# Altium schematic sheet 05 - FPGA_IO_SRAM.SchDoc
size A3; SheetNumber: 3; SheetTotal: 7
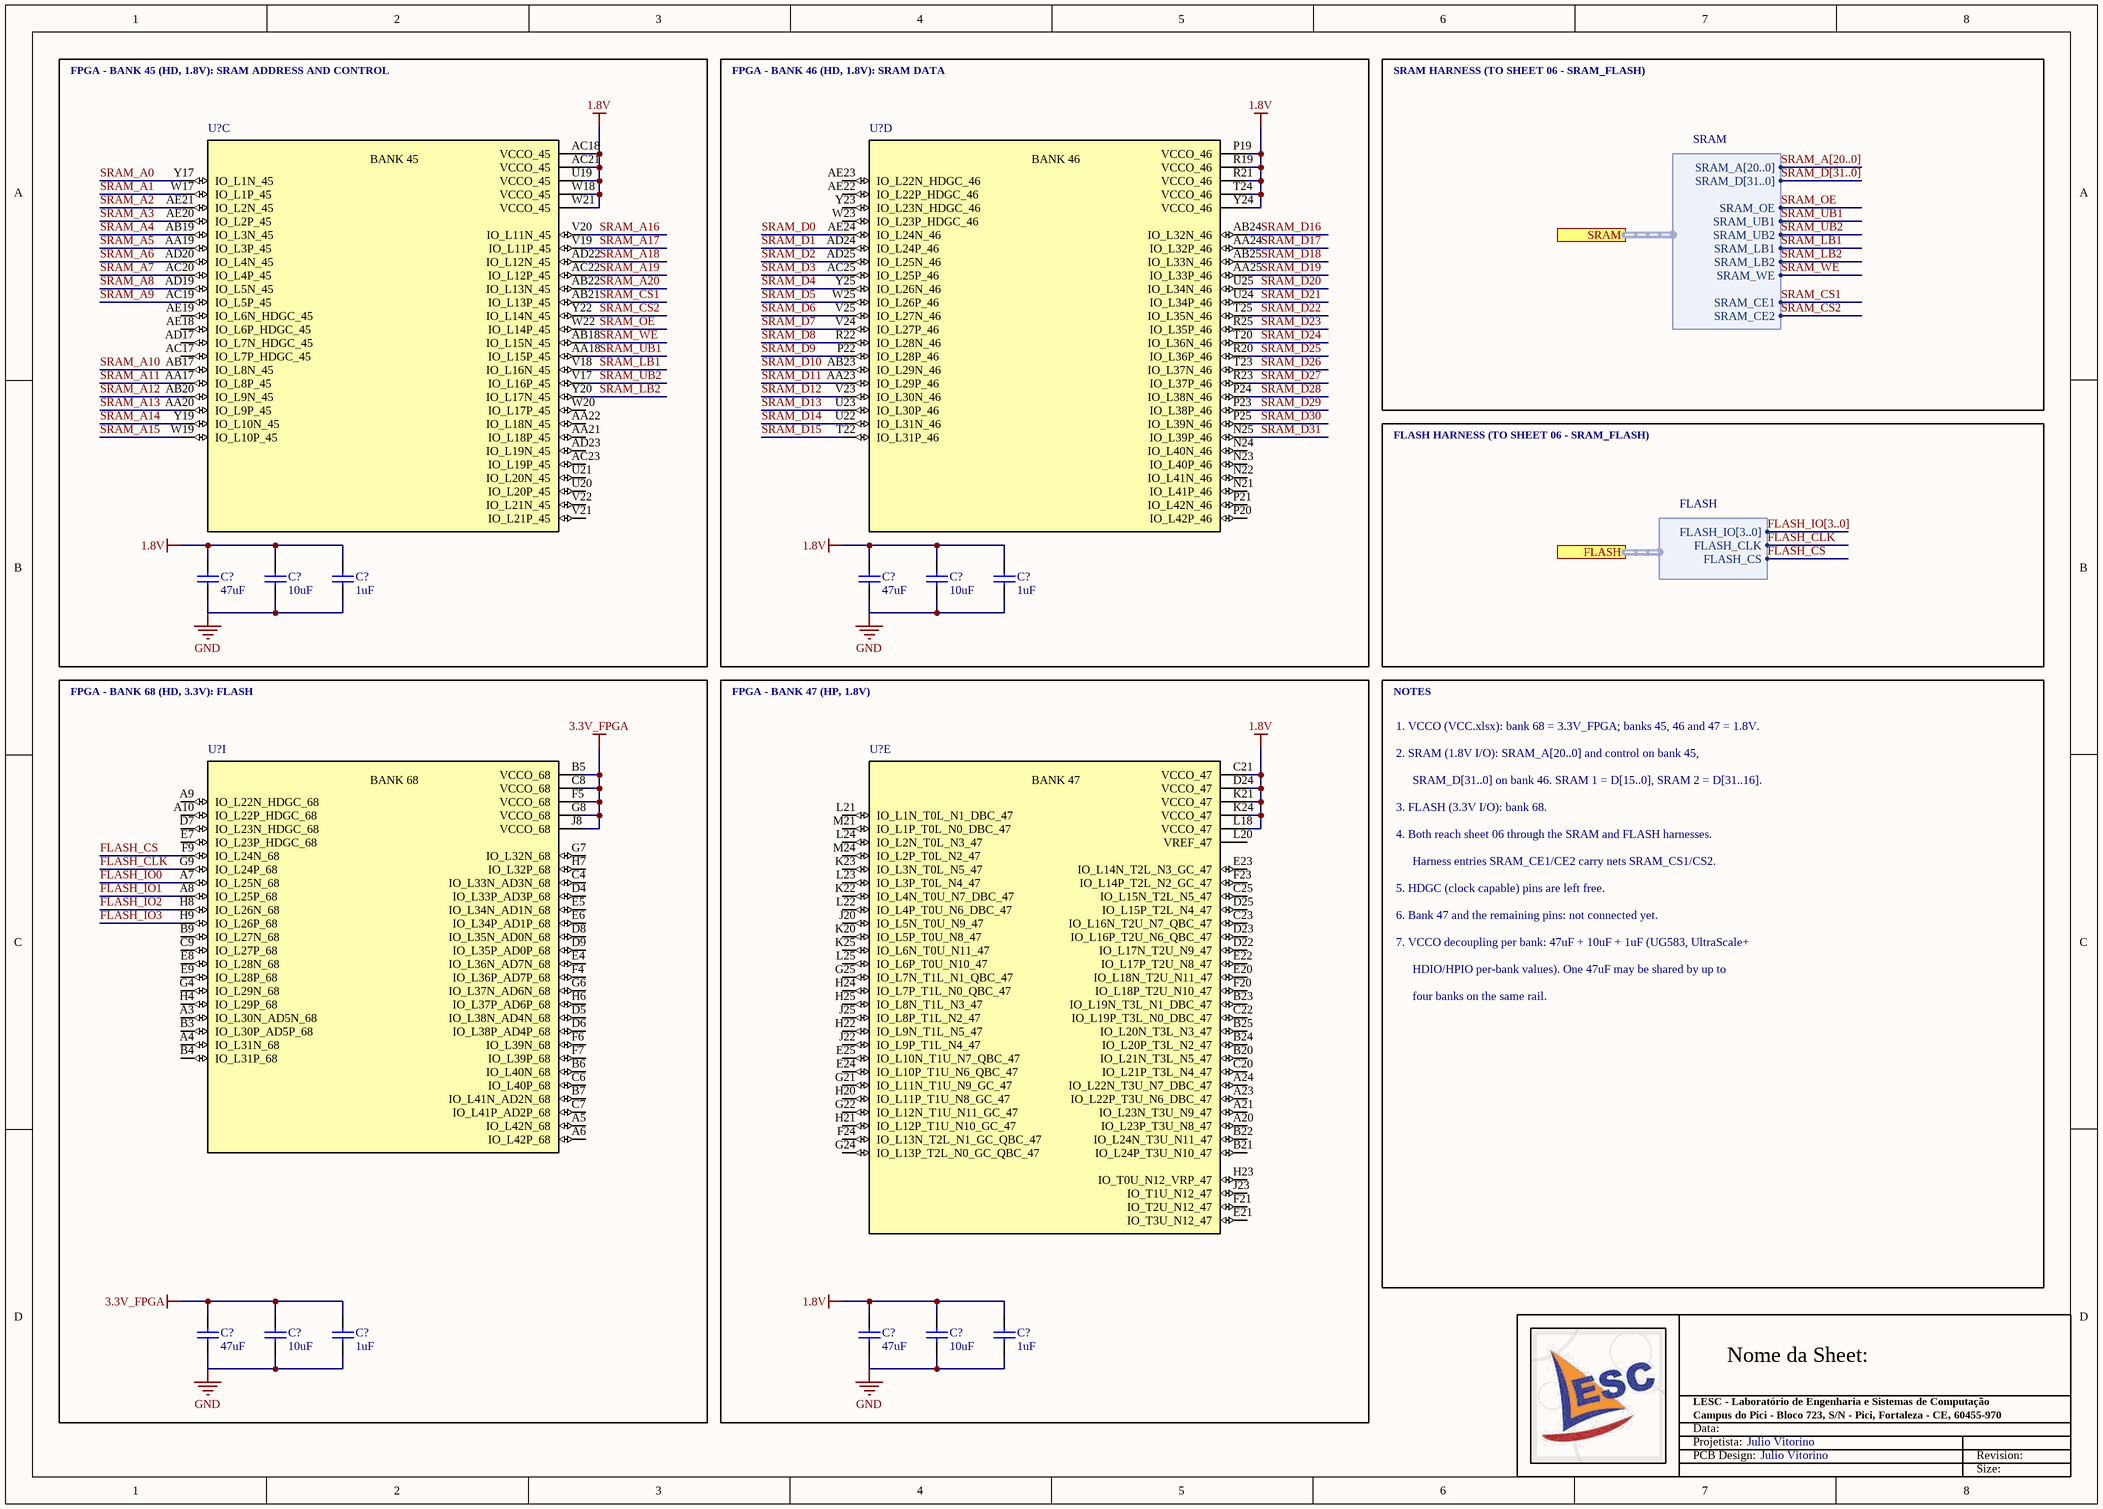
[diagram p0: 05 - FPGA_IO_SRAM.SchDoc]

## Parts
(Parts that share a designator on the sheet are numbered #1, #2 ... from top to bottom, then left to right.)
C?#1  value 47uF  [0603-C-R]  (hidden comment: ZRB18AR60J476ME01L)
C?#2  CAPACITANCE: 10uF  [0402-C-R]  (hidden comment: CAP CER 10UF 6.3V X5R 0402)
C?#3  value 1uF  [0402-C-R]  (hidden comment: JMK105BJ105KV-F)
C?#4  value 47uF  [0603-C-R]  (hidden comment: ZRB18AR60J476ME01L)
C?#5  CAPACITANCE: 10uF  [0402-C-R]  (hidden comment: CAP CER 10UF 6.3V X5R 0402)
C?#6  value 1uF  [0402-C-R]  (hidden comment: JMK105BJ105KV-F)
C?#7  value 47uF  [0603-C-R]  (hidden comment: ZRB18AR60J476ME01L)
C?#8  CAPACITANCE: 10uF  [0402-C-R]  (hidden comment: CAP CER 10UF 6.3V X5R 0402)
C?#9  value 1uF  [0402-C-R]  (hidden comment: JMK105BJ105KV-F)
C?#10  value 47uF  [0603-C-R]  (hidden comment: ZRB18AR60J476ME01L)
C?#11  CAPACITANCE: 10uF  [0402-C-R]  (hidden comment: CAP CER 10UF 6.3V X5R 0402)
C?#12  value 1uF  [0402-C-R]  (hidden comment: JMK105BJ105KV-F)
U?#1  IC FPGA 304 I/O 625-BGA/FCBGA  [BGA625C80P25X25_2100X2100X192]  (value not drawn)  (part C of 11)
U?#2  IC FPGA 304 I/O 625-BGA/FCBGA  [BGA625C80P25X25_2100X2100X192]  (value not drawn)  (part D of 11)
U?#3  IC FPGA 304 I/O 625-BGA/FCBGA  [BGA625C80P25X25_2100X2100X192]  (value not drawn)  (part I of 11)
U?#4  IC FPGA 304 I/O 625-BGA/FCBGA  [BGA625C80P25X25_2100X2100X192]  (value not drawn)  (part E of 11)

## Blocks framed on the sheet
FPGA - BANK 45 (HD, 1.8V): SRAM ADDRESS AND CONTROL: C?#1-C?#3 U?#1
FPGA - BANK 46 (HD, 1.8V): SRAM DATA: C?#4-C?#6 U?#2
FPGA - BANK 68 (HD, 3.3V): FLASH: C?#7-C?#9 U?#3
FPGA - BANK 47 (HP, 1.8V): C?#10-C?#12 U?#4

## Ports
FLASH (harness FLASH), SRAM (harness SRAM)

## Harnesses
SRAM: SRAM_A[20..0], SRAM_D[31..0], SRAM_OE, SRAM_UB1, SRAM_UB2, SRAM_WE, SRAM_CE1, SRAM_CE2, SRAM_LB2, SRAM_LB1
FLASH: FLASH_IO[3..0], FLASH_CLK, FLASH_CS

## Nets
1.8V: C?#1.2 C?#2.2 C?#3.2 C?#4.2 C?#5.2 C?#6.2 C?#10.2 C?#11.2 C?#12.2 U?#1.AC18(VCCO_45) U?#1.AC21(VCCO_45) U?#1.U19(VCCO_45) U?#1.W18(VCCO_45) U?#1.W21(VCCO_45) U?#2.P19(VCCO_46) U?#2.R19(VCCO_46) U?#2.R21(VCCO_46) U?#2.T24(VCCO_46) U?#2.Y24(VCCO_46) U?#4.C21(VCCO_47) U?#4.D24(VCCO_47) U?#4.K21(VCCO_47) U?#4.K24(VCCO_47) U?#4.L18(VCCO_47)
3.3V_FPGA: C?#7.2 C?#8.2 C?#9.2 U?#3.B5(VCCO_68) U?#3.C8(VCCO_68) U?#3.F5(VCCO_68) U?#3.G8(VCCO_68) U?#3.J8(VCCO_68)
GND: C?#1.1 C?#2.1 C?#3.1 C?#4.1 C?#5.1 C?#6.1 C?#7.1 C?#8.1 C?#9.1 C?#10.1 C?#11.1 C?#12.1
FLASH_CLK: U?#3.G9(IO_L24P_68) ; port FLASH.FLASH_CLK
FLASH_CS: U?#3.F9(IO_L24N_68) ; port FLASH.FLASH_CS
FLASH_IO0: U?#3.A7(IO_L25N_68)
FLASH_IO1: U?#3.A8(IO_L25P_68)
FLASH_IO2: U?#3.H8(IO_L26N_68)
FLASH_IO3: U?#3.H9(IO_L26P_68)
SRAM_A0: U?#1.Y17(IO_L1N_45)
SRAM_A1: U?#1.W17(IO_L1P_45)
SRAM_A2: U?#1.AE21(IO_L2N_45)
SRAM_A3: U?#1.AE20(IO_L2P_45)
SRAM_A4: U?#1.AB19(IO_L3N_45)
SRAM_A5: U?#1.AA19(IO_L3P_45)
SRAM_A6: U?#1.AD20(IO_L4N_45)
SRAM_A7: U?#1.AC20(IO_L4P_45)
SRAM_A8: U?#1.AD19(IO_L5N_45)
SRAM_A9: U?#1.AC19(IO_L5P_45)
SRAM_A10: U?#1.AB17(IO_L8N_45)
SRAM_A11: U?#1.AA17(IO_L8P_45)
SRAM_A12: U?#1.AB20(IO_L9N_45)
SRAM_A13: U?#1.AA20(IO_L9P_45)
SRAM_A14: U?#1.Y19(IO_L10N_45)
SRAM_A15: U?#1.W19(IO_L10P_45)
SRAM_A16: U?#1.V20(IO_L11N_45)
SRAM_A17: U?#1.V19(IO_L11P_45)
SRAM_A18: U?#1.AD22(IO_L12N_45)
SRAM_A19: U?#1.AC22(IO_L12P_45)
SRAM_A20: U?#1.AB22(IO_L13N_45)
SRAM_CS1: U?#1.AB21(IO_L13P_45) ; port SRAM.SRAM_CE1
SRAM_CS2: U?#1.Y22(IO_L14N_45) ; port SRAM.SRAM_CE2
SRAM_D0: U?#2.AE24(IO_L24N_46)
SRAM_D1: U?#2.AD24(IO_L24P_46)
SRAM_D2: U?#2.AD25(IO_L25N_46)
SRAM_D3: U?#2.AC25(IO_L25P_46)
SRAM_D4: U?#2.Y25(IO_L26N_46)
SRAM_D5: U?#2.W25(IO_L26P_46)
SRAM_D6: U?#2.V25(IO_L27N_46)
SRAM_D7: U?#2.V24(IO_L27P_46)
SRAM_D8: U?#2.R22(IO_L28N_46)
SRAM_D9: U?#2.P22(IO_L28P_46)
SRAM_D10: U?#2.AB23(IO_L29N_46)
SRAM_D11: U?#2.AA23(IO_L29P_46)
SRAM_D12: U?#2.V23(IO_L30N_46)
SRAM_D13: U?#2.U23(IO_L30P_46)
SRAM_D14: U?#2.U22(IO_L31N_46)
SRAM_D15: U?#2.T22(IO_L31P_46)
SRAM_D16: U?#2.AB24(IO_L32N_46)
SRAM_D17: U?#2.AA24(IO_L32P_46)
SRAM_D18: U?#2.AB25(IO_L33N_46)
SRAM_D19: U?#2.AA25(IO_L33P_46)
SRAM_D20: U?#2.U25(IO_L34N_46)
SRAM_D21: U?#2.U24(IO_L34P_46)
SRAM_D22: U?#2.T25(IO_L35N_46)
SRAM_D23: U?#2.R25(IO_L35P_46)
SRAM_D24: U?#2.T20(IO_L36N_46)
SRAM_D25: U?#2.R20(IO_L36P_46)
SRAM_D26: U?#2.T23(IO_L37N_46)
SRAM_D27: U?#2.R23(IO_L37P_46)
SRAM_D28: U?#2.P24(IO_L38N_46)
SRAM_D29: U?#2.P23(IO_L38P_46)
SRAM_D30: U?#2.P25(IO_L39N_46)
SRAM_D31: U?#2.N25(IO_L39P_46)
SRAM_LB1: U?#1.V18(IO_L16N_45) ; port SRAM.SRAM_LB1
SRAM_LB2: U?#1.Y20(IO_L17N_45) ; port SRAM.SRAM_LB2
SRAM_OE: U?#1.W22(IO_L14P_45) ; port SRAM.SRAM_OE
SRAM_UB1: U?#1.AA18(IO_L15P_45) ; port SRAM.SRAM_UB1
SRAM_UB2: U?#1.V17(IO_L16P_45) ; port SRAM.SRAM_UB2
SRAM_WE: U?#1.AB18(IO_L15N_45) ; port SRAM.SRAM_WE

Not connected (* = marked no-connect by the designer): U?#1 AA21(IO_L18P_45) AA22(IO_L18N_45) AC17(IO_L7P_HDGC_45) AC23(IO_L19P_45) AD17(IO_L7N_HDGC_45) AD23(IO_L19N_45) AE18(IO_L6P_HDGC_45) AE19(IO_L6N_HDGC_45) U20(IO_L20P_45) U21(IO_L20N_45) V21(IO_L21P_45) V22(IO_L21N_45) W20(IO_L17P_45); U?#2 AE22(IO_L22P_HDGC_46) AE23(IO_L22N_HDGC_46) N21(IO_L41P_46) N22(IO_L41N_46) N23(IO_L40P_46) N24(IO_L40N_46) P20(IO_L42P_46) P21(IO_L42N_46) W23(IO_L23P_HDGC_46) Y23(IO_L23N_HDGC_46); U?#3 A3(IO_L30N_AD5N_68) A4(IO_L31N_68) A5(IO_L42N_68) A6(IO_L42P_68) A9(IO_L22N_HDGC_68) A10(IO_L22P_HDGC_68) B3(IO_L30P_AD5P_68) B4(IO_L31P_68) B6(IO_L40N_68) B7(IO_L41N_AD2N_68) B9(IO_L27N_68) C4(IO_L33N_AD3N_68) C6(IO_L40P_68) C7(IO_L41P_AD2P_68) C9(IO_L27P_68) D4(IO_L33P_AD3P_68) D5(IO_L38N_AD4N_68) D6(IO_L38P_AD4P_68) D7(IO_L23N_HDGC_68) D8(IO_L35N_AD0N_68) D9(IO_L35P_AD0P_68) E4(IO_L36N_AD7N_68) E5(IO_L34N_AD1N_68) E6(IO_L34P_AD1P_68) E7(IO_L23P_HDGC_68) E8(IO_L28N_68) E9(IO_L28P_68) F4(IO_L36P_AD7P_68) F6(IO_L39N_68) F7(IO_L39P_68) G4(IO_L29N_68) G6(IO_L37N_AD6N_68) G7(IO_L32N_68) H4(IO_L29P_68) H6(IO_L37P_AD6P_68) H7(IO_L32P_68); U?#4 A20(IO_L23P_T3U_N8_47) A21(IO_L23N_T3U_N9_47) A23(IO_L22P_T3U_N6_DBC_47) A24(IO_L22N_T3U_N7_DBC_47) B20(IO_L21N_T3L_N5_47) B21(IO_L24P_T3U_N10_47) B22(IO_L24N_T3U_N11_47) B23(IO_L19N_T3L_N1_DBC_47) B24(IO_L20P_T3L_N2_47) B25(IO_L20N_T3L_N3_47) C20(IO_L21P_T3L_N4_47) C22(IO_L19P_T3L_N0_DBC_47) C23(IO_L16N_T2U_N7_QBC_47) C25(IO_L15N_T2L_N5_47) D22(IO_L17N_T2U_N9_47) D23(IO_L16P_T2U_N6_QBC_47) D25(IO_L15P_T2L_N4_47) E20(IO_L18N_T2U_N11_47) E21(IO_T3U_N12_47) E22(IO_L17P_T2U_N8_47) E23(IO_L14N_T2L_N3_GC_47) E24(IO_L10P_T1U_N6_QBC_47) E25(IO_L10N_T1U_N7_QBC_47) F20(IO_L18P_T2U_N10_47) F21(IO_T2U_N12_47) F23(IO_L14P_T2L_N2_GC_47) F24(IO_L13N_T2L_N1_GC_QBC_47) G21(IO_L11N_T1U_N9_GC_47) G22(IO_L12N_T1U_N11_GC_47) G24(IO_L13P_T2L_N0_GC_QBC_47) G25(IO_L7N_T1L_N1_QBC_47) H20(IO_L11P_T1U_N8_GC_47) H21(IO_L12P_T1U_N10_GC_47) H22(IO_L9N_T1L_N5_47) H23(IO_T0U_N12_VRP_47) H24(IO_L7P_T1L_N0_QBC_47) H25(IO_L8N_T1L_N3_47) J20(IO_L5N_T0U_N9_47) J22(IO_L9P_T1L_N4_47) J23(IO_T1U_N12_47) J25(IO_L8P_T1L_N2_47) K20(IO_L5P_T0U_N8_47) K22(IO_L4N_T0U_N7_DBC_47) K23(IO_L3N_T0L_N5_47) K25(IO_L6N_T0U_N11_47) L20(VREF_47) L21(IO_L1N_T0L_N1_DBC_47) L22(IO_L4P_T0U_N6_DBC_47) L23(IO_L3P_T0L_N4_47) L24(IO_L2N_T0L_N3_47) L25(IO_L6P_T0U_N10_47) M21(IO_L1P_T0L_N0_DBC_47) M24(IO_L2P_T0L_N2_47)

## Buses and harness runs
bus FLASH_IO[3..0]
bus SRAM_A[20..0]
bus SRAM_D[31..0]

## Notes on the sheet
- SRAM HARNESS (TO SHEET 06 - SRAM_FLASH)
- FLASH HARNESS (TO SHEET 06 - SRAM_FLASH)
- NOTES
- 1. VCCO (VCC.xlsx): bank 68 = 3.3V_FPGA; banks 45, 46 and 47 = 1.8V.
- 2. SRAM (1.8V I/O): SRAM_A[20..0] and control on bank 45,
- SRAM_D[31..0] on bank 46. SRAM 1 = D[15..0], SRAM 2 = D[31..16].
- 3. FLASH (3.3V I/O): bank 68.
- 4. Both reach sheet 06 through the SRAM and FLASH harnesses.
- 5. HDGC (clock capable) pins are left free.
- 6. Bank 47 and the remaining pins: not connected yet.
- Harness entries SRAM_CE1/CE2 carry nets SRAM_CS1/CS2.
- 7. VCCO decoupling per bank: 47uF + 10uF + 1uF (UG583, UltraScale+
- HDIO/HPIO per-bank values). One 47uF may be shared by up to
- four banks on the same rail.
- Nome da Sheet:
- Data:
- Projetista:
- PCB Design:
- LESC - Laboratório de Engenharia e Sistemas de Computação
- Campus do Pici - Bloco 723, S/N - Pici, Fortaleza - CE, 60455-970
- Julio Vitorino
- Revision:
- Size:
- (in symbol IC FPGA 304 I/O 625-BGA/FCBGA, part C) BANK 45
- (in symbol IC FPGA 304 I/O 625-BGA/FCBGA, part D) BANK 46
- (in symbol IC FPGA 304 I/O 625-BGA/FCBGA, part E) BANK 47
- (in symbol IC FPGA 304 I/O 625-BGA/FCBGA, part I) BANK 68

## Library data of the parts
C?#1 C?#4 C?#7 C?#10 = CAP CER 47UF 6.3V X5R 0603: 47 µF ±20% 6.3V Ceramic Capacitor X5R 0603 (1608 Metric); SIZE: 0603; PN: ZRB18AR60J476ME01L; VOLTAGE: 6.3V; TOLERANCE: 20%
C?#2 C?#5 C?#8 C?#11 = CAP CER 10UF 6.3V X5R 0402: 10 µF ±20% 6.3V Ceramic Capacitor X5R 0402 (1005 Metric) / PN: GRM155R60J106ME05D; Mfr_Name: Murata; Type: Ceramic Capacitors; PN: GRM155R60J106ME05D
C?#3 C?#6 C?#9 C?#12 = CAP CER 1UF 6.3V X5R 0402: 1 µF ±10% 6.3V Ceramic Capacitor X5R 0402 (1005 Metric); SIZE: 0402; VOLTAGE: 6.3V; TOLERANCE: 10%; PN: JMK105BJ105KV-F
U?#1-U?#4 = IC FPGA 304 I/O 625-BGA/FCBGA: IC FPGA 304 I/O 625-BGA/FCBGA PN: XCSU35P-1SBVB625I; MF: AMD; Package: None; Price: None; Value: *; SnapEDA_Link: https://www.snapeda.com/parts/XCSU10P-2SBVB625I/AMD/view-part/?ref=snap; PN: XCSU35P-1SBVB625I; Availability: Unavailable; Check_prices: https://www.snapeda.com/parts/XCSU10P-2SBVB625I/AMD/view-part/?ref=eda